# EAGLE schematic RGB_IR_J010131revC (EAGLE 7.7.0), part 2 of 2
## Sheet 4 of 4
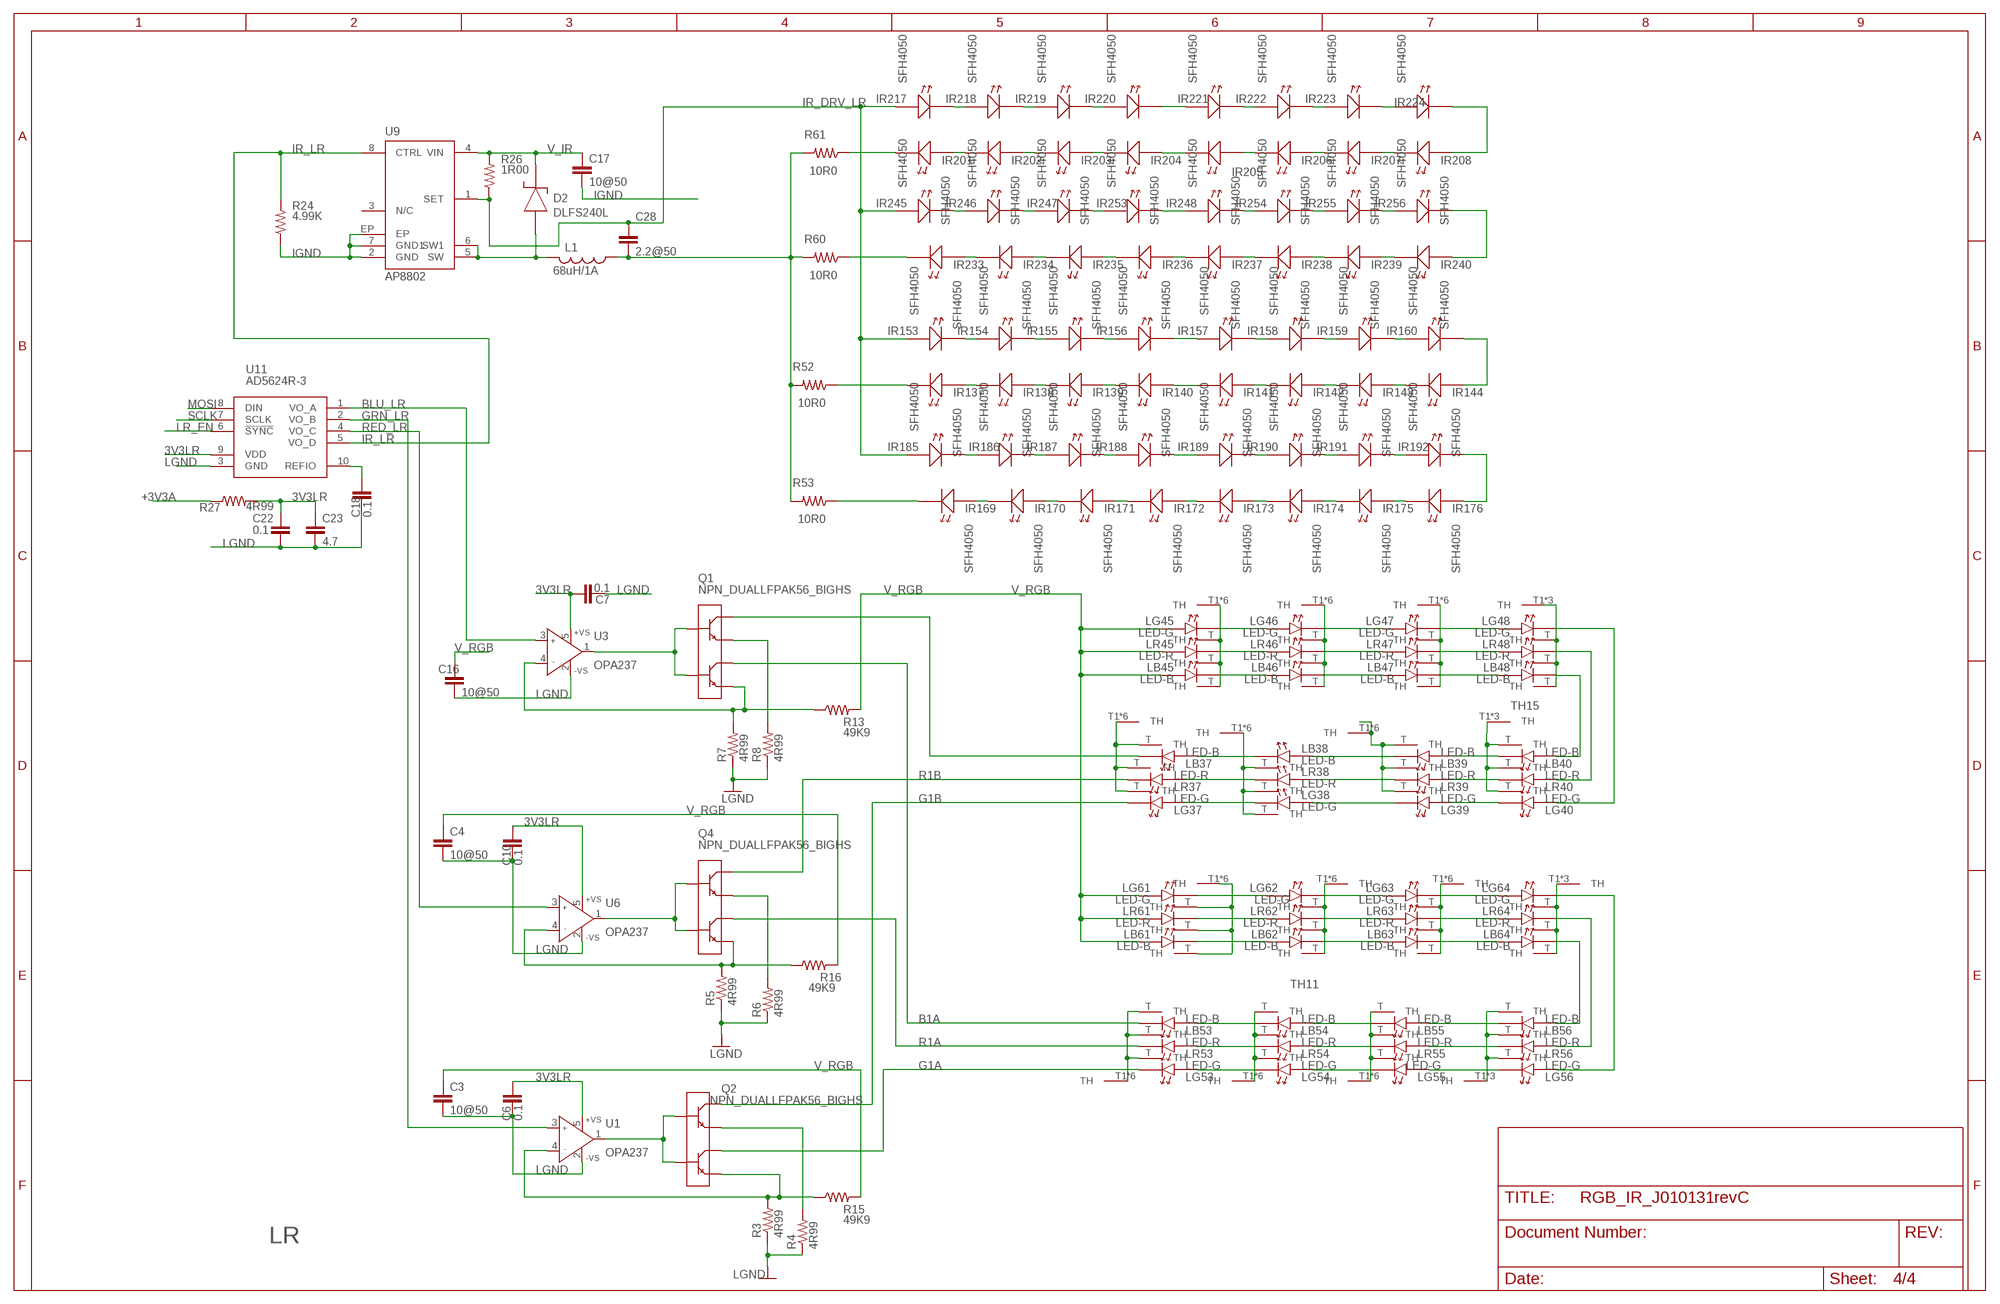
[diagram p3: schematic, sheet 4]

### Parts
C3  10@50  CAPS1210S  [1210S]
C4  10@50  CAPS1210S  [1210S]
C6  0.1  CAPS0603S  [0603S]
C7  0.1  CAPS0603S  [0603S]
C10  0.1  CAPS0603S  [0603S]
C16  10@50  CAPS1210S  [1210S]
C17  10@50  CAPS1210S  [1210S]
C18  0.1  CAPS0603S  [0603S]
C22  0.1  CAPS0603S  [0603S]
C23  4.7  CAPS0805S  [0805S]
C28  2.2@50  CAPS1206S  [1206S]
D2  DLFS240L  DIODE_SCHOTTKYPWRDI-123  [PWRDI-123]
IR137  SFH4050  LEDLED_SFH4050  [LED_SFH4050]
IR138  SFH4050  LEDLED_SFH4050_HEAT  [LED_SFH4050_HEAT]
IR139  SFH4050  LEDLED_SFH4050_HEAT  [LED_SFH4050_HEAT]
IR140  SFH4050  LEDLED_SFH4050_HEAT  [LED_SFH4050_HEAT]
IR141  SFH4050  LEDLED_SFH4050_HEAT  [LED_SFH4050_HEAT]
IR142  SFH4050  LEDLED_SFH4050_HEAT  [LED_SFH4050_HEAT]
IR143  SFH4050  LEDLED_SFH4050_HEAT  [LED_SFH4050_HEAT]
IR144  SFH4050  LEDLED_SFH4050_HEAT  [LED_SFH4050_HEAT]
IR153  SFH4050  LEDLED_SFH4050_HEAT  [LED_SFH4050_HEAT]
IR154  SFH4050  LEDLED_SFH4050_A  [LED_SFH4045_HEAT_A]
IR155  SFH4050  LEDLED_SFH4050_HEAT  [LED_SFH4050_HEAT]
IR156  SFH4050  LEDLED_SFH4050_HEAT  [LED_SFH4050_HEAT]
IR157  SFH4050  LEDLED_SFH4050_HEAT  [LED_SFH4050_HEAT]
IR158  SFH4050  LEDLED_SFH4050_HEAT  [LED_SFH4050_HEAT]
IR159  SFH4050  LEDLED_SFH4050_HEAT  [LED_SFH4050_HEAT]
IR160  SFH4050  LEDLED_SFH4050_HEAT  [LED_SFH4050_HEAT]
IR169  SFH4050  LEDLED_SFH4050_HEAT  [LED_SFH4050_HEAT]
IR170  SFH4050  LEDLED_SFH4050_HEAT  [LED_SFH4050_HEAT]
IR171  SFH4050  LEDLED_SFH4050_HEAT  [LED_SFH4050_HEAT]
IR172  SFH4050  LEDLED_SFH4050_HEAT  [LED_SFH4050_HEAT]
IR173  SFH4050  LEDLED_SFH4050_HEAT  [LED_SFH4050_HEAT]
IR174  SFH4050  LEDLED_SFH4050_HEAT  [LED_SFH4050_HEAT]
IR175  SFH4050  LEDLED_SFH4050_HEAT  [LED_SFH4050_HEAT]
IR176  SFH4050  LEDLED_SFH4050_HEAT  [LED_SFH4050_HEAT]
IR185  SFH4050  LEDLED_SFH4050_HEAT  [LED_SFH4050_HEAT]
IR186  SFH4050  LEDLED_SFH4050_HEAT  [LED_SFH4050_HEAT]
IR187  SFH4050  LEDLED_SFH4050_HEAT  [LED_SFH4050_HEAT]
IR188  SFH4050  LEDLED_SFH4050_HEAT  [LED_SFH4050_HEAT]
IR189  SFH4050  LEDLED_SFH4050_HEAT  [LED_SFH4050_HEAT]
IR190  SFH4050  LEDLED_SFH4050_HEAT  [LED_SFH4050_HEAT]
IR191  SFH4050  LEDLED_SFH4050_HEAT  [LED_SFH4050_HEAT]
IR192  SFH4050  LEDLED_SFH4050_HEAT  [LED_SFH4050_HEAT]
IR201  SFH4050  LEDLED_SFH4050_HEAT  [LED_SFH4050_HEAT]
IR202  SFH4050  LEDLED_SFH4050_HEAT  [LED_SFH4050_HEAT]
IR203  SFH4050  LEDLED_SFH4050_HEAT  [LED_SFH4050_HEAT]
IR204  SFH4050  LEDLED_SFH4050_HEAT  [LED_SFH4050_HEAT]
IR205  SFH4050  LEDLED_SFH4050_HEAT  [LED_SFH4050_HEAT]
IR206  SFH4050  LEDLED_SFH4050_HEAT  [LED_SFH4050_HEAT]
IR207  SFH4050  LEDLED_SFH4050_HEAT  [LED_SFH4050_HEAT]
IR208  SFH4050  LEDLED_SFH4050_HEAT  [LED_SFH4050_HEAT]
IR217  SFH4050  LEDLED_SFH4050_HEAT  [LED_SFH4050_HEAT]
IR218  SFH4050  LEDLED_SFH4050_HEAT  [LED_SFH4050_HEAT]
IR219  SFH4050  LEDLED_SFH4050_HEAT  [LED_SFH4050_HEAT]
IR220  SFH4050  LEDLED_SFH4050_HEAT  [LED_SFH4050_HEAT]
IR221  SFH4050  LEDLED_SFH4050_HEAT  [LED_SFH4050_HEAT]
IR222  SFH4050  LEDLED_SFH4050_HEAT  [LED_SFH4050_HEAT]
IR223  SFH4050  LEDLED_SFH4050_HEAT  [LED_SFH4050_HEAT]
IR224  SFH4050  LEDLED_SFH4050_HEAT  [LED_SFH4050_HEAT]
IR233  SFH4050  LEDLED_SFH4050_HEAT  [LED_SFH4050_HEAT]
IR234  SFH4050  LEDLED_SFH4050_HEAT  [LED_SFH4050_HEAT]
IR235  SFH4050  LEDLED_SFH4050_HEAT  [LED_SFH4050_HEAT]
IR236  SFH4050  LEDLED_SFH4050_HEAT  [LED_SFH4050_HEAT]
IR237  SFH4050  LEDLED_SFH4050_HEAT  [LED_SFH4050_HEAT]
IR238  SFH4050  LEDLED_SFH4050_HEAT  [LED_SFH4050_HEAT]
IR239  SFH4050  LEDLED_SFH4050_HEAT  [LED_SFH4050_HEAT]
IR240  SFH4050  LEDLED_SFH4050_HEAT  [LED_SFH4050_HEAT]
IR245  SFH4050  LEDLED_SFH4050_HEAT  [LED_SFH4050_HEAT]
IR246  SFH4050  LEDLED_SFH4050_HEAT  [LED_SFH4050_HEAT]
IR247  SFH4050  LEDLED_SFH4050_HEAT  [LED_SFH4050_HEAT]
IR248  SFH4050  LEDLED_SFH4050_HEAT  [LED_SFH4050_HEAT]
IR253  SFH4050  LEDLED_SFH4050_HEAT  [LED_SFH4050_HEAT]
IR254  SFH4050  LEDLED_SFH4050_HEAT  [LED_SFH4050_HEAT]
IR255  SFH4050  LEDLED_SFH4050_HEAT  [LED_SFH4050_HEAT]
IR256  SFH4050  LEDLED_SFH4050  [LED_SFH4050]
L1  68uH/1A  INDUCTOR_SMSRU8043  [SRU8043]
LB37  LED-B  LED-TH  [SUNPLUS-LED]
LB38  LED-B  LED-TH  [SUNPLUS-LED]
LB39  LED-B  LED-TH  [SUNPLUS-LED]
LB40  LED-B  LED-TH  [SUNPLUS-LED]
LB45  LED-B  LED-TH  [SUNPLUS-LED]
LB46  LED-B  LED-TH  [SUNPLUS-LED]
LB47  LED-B  LED-TH  [SUNPLUS-LED]
LB48  LED-B  LED-TH  [SUNPLUS-LED]
LB53  LED-B  LED-TH  [SUNPLUS-LED]
LB54  LED-B  LED-TH  [SUNPLUS-LED]
LB55  LED-B  LED-TH  [SUNPLUS-LED]
LB56  LED-B  LED-TH  [SUNPLUS-LED]
LB61  LED-B  LED-TH  [SUNPLUS-LED]
LB62  LED-B  LED-TH  [SUNPLUS-LED]
LB63  LED-B  LED-TH  [SUNPLUS-LED]
LB64  LED-B  LED-TH  [SUNPLUS-LED]
LG37  LED-G  LED-TH  [SUNPLUS-LED]
LG38  LED-G  LED-TH  [SUNPLUS-LED]
LG39  LED-G  LED-TH  [SUNPLUS-LED]
LG40  LED-G  LED-TH  [SUNPLUS-LED]
LG45  LED-G  LED-TH  [SUNPLUS-LED]
LG46  LED-G  LED-TH  [SUNPLUS-LED]
LG47  LED-G  LED-TH  [SUNPLUS-LED]
LG48  LED-G  LED-TH  [SUNPLUS-LED]
LG53  LED-G  LED-TH  [SUNPLUS-LED]
LG54  LED-G  LED-TH  [SUNPLUS-LED]
LG55  LED-G  LED-TH  [SUNPLUS-LED]
LG56  LED-G  LED-TH  [SUNPLUS-LED]
LG61  LED-G  LED-TH  [SUNPLUS-LED]
LG62  LED-G  LED-TH  [SUNPLUS-LED]
LG63  LED-G  LED-TH  [SUNPLUS-LED]
LG64  LED-G  LED-TH  [SUNPLUS-LED]
LR37  LED-R  LED-TH  [SUNPLUS-LED]
LR38  LED-R  LED-TH  [SUNPLUS-LED]
LR39  LED-R  LED-TH  [SUNPLUS-LED]
LR40  LED-R  LED-TH  [SUNPLUS-LED]
LR45  LED-R  LED-TH  [SUNPLUS-LED]
LR46  LED-R  LED-TH  [SUNPLUS-LED]
LR47  LED-R  LED-TH  [SUNPLUS-LED]
LR48  LED-R  LED-TH  [SUNPLUS-LED]
LR53  LED-R  LED-TH  [SUNPLUS-LED]
LR54  LED-R  LED-TH  [SUNPLUS-LED]
LR55  LED-R  LED-TH  [SUNPLUS-LED]
LR56  LED-R  LED-TH  [SUNPLUS-LED]
LR61  LED-R  LED-TH  [SUNPLUS-LED]
LR62  LED-R  LED-TH  [SUNPLUS-LED]
LR63  LED-R  LED-TH  [SUNPLUS-LED]
LR64  LED-R  LED-TH  [SUNPLUS-LED]
Q1  NPN_DUALLFPAK56_BIGHS  [LFPAK56_HS2]
Q2  NPN_DUALLFPAK56_BIGHS  [LFPAK56_HS2]
Q4  NPN_DUALLFPAK56_BIGHS  [LFPAK56_HS2]
R3  4R99  RESISTOR-POWER1812  [1812]
R4  4R99  RESISTOR-POWER1812  [1812]
R5  4R99  RESISTOR-POWER1812  [1812]
R6  4R99  RESISTOR-POWER1812  [1812]
R7  4R99  RESISTOR-POWER1812  [1812]
R8  4R99  RESISTOR-POWER1812  [1812]
R13  49K9  RESISTOR_SM1206S  [1206S]
R15  49K9  RESISTOR_SM1206S  [1206S]
R16  49K9  RESISTOR_SM1206S  [1206S]
R24  4.99K  RESISTOR_SM0805S  [0805S]
R26  1R00  RESISTOR_SM1206S  [1206S]
R27  4R99  RESISTOR_SM0805S  [0805S]
R52  10R0  RESISTOR_SM1206S  [1206S]
R53  10R0  RESISTOR_SM1206S  [1206S]
R60  10R0  RESISTOR_SM1206S  [1206S]
R61  10R0  RESISTOR_SM1206S  [1206S]
U1  OPA237  AD8065RT  [SOT23-5]
U3  OPA237  AD8065RT  [SOT23-5]
U6  OPA237  AD8065RT  [SOT23-5]
U9  AP8802  [SOIC8-EP]
U11  AD5624R-3  AD56X4R  [MSOP10]
V37  SUNPLUS-VIAS-ONLY  [SUNPLUS-VIAS-ONLY]
V38  SUNPLUS-VIAS-ONLY  [SUNPLUS-VIAS-ONLY]
V39  SUNPLUS-VIAS-ONLY  [SUNPLUS-VIAS-ONLY]
V40  SUNPLUS-VIAS-ONLYTOPVIAS  [SUNPLUS-TOP-VIAS-ONLY]
V45  SUNPLUS-VIAS-ONLY  [SUNPLUS-VIAS-ONLY]
V46  SUNPLUS-VIAS-ONLY  [SUNPLUS-VIAS-ONLY]
V47  SUNPLUS-VIAS-ONLY  [SUNPLUS-VIAS-ONLY]
V48  SUNPLUS-VIAS-ONLYTOPVIAS  [SUNPLUS-TOP-VIAS-ONLY]
V53  SUNPLUS-VIAS-ONLY  [SUNPLUS-VIAS-ONLY]
V54  SUNPLUS-VIAS-ONLY  [SUNPLUS-VIAS-ONLY]
V55  SUNPLUS-VIAS-ONLY  [SUNPLUS-VIAS-ONLY]
V56  SUNPLUS-VIAS-ONLYTOPVIAS  [SUNPLUS-TOP-VIAS-ONLY]
V61  SUNPLUS-VIAS-ONLY  [SUNPLUS-VIAS-ONLY]
V62  SUNPLUS-VIAS-ONLY  [SUNPLUS-VIAS-ONLY]
V63  SUNPLUS-VIAS-ONLY  [SUNPLUS-VIAS-ONLY]
V64  SUNPLUS-VIAS-ONLYTOPVIAS  [SUNPLUS-TOP-VIAS-ONLY]

### Nets
3V3LR: C6.1 C7.1 C10.1 C22.1 C23.1 R27.2 U1.5(+VS) U3.5(+VS) U6.5(+VS) U11.9(VDD)
+3V3A: R27.1 ; also sheet 1,2,3
B1A: LB53.GC(K) Q1.5(C2) Q1.5A1(C2) Q1.5A(C2) Q1.5B(C2) Q1.5C1(C2) Q1.5C2(C2) Q1.5C(C2) Q1.6(C2) Q1.56(C2) Q1.56A(C2) Q1.56B(C2)
B1B: LB37.GC(K) Q1.7(C1) Q1.8(C1) Q1.8A(C1) Q1.8B(C1) Q1.8C1(C1) Q1.8C2(C1) Q1.8C3(C1) Q1.8C(C1) Q1.78(C1) Q1.78A(C1) Q1.78B(C1)
BLU_LR: U3.3(IN+) U11.1(VO_A)
G1A: LG53.GC(K) Q2.5(C2) Q2.5A1(C2) Q2.5A(C2) Q2.5B(C2) Q2.5C1(C2) Q2.5C2(C2) Q2.5C(C2) Q2.6(C2) Q2.56(C2) Q2.56A(C2) Q2.56B(C2)
G1B: LG37.GC(K) Q2.7(C1) Q2.8(C1) Q2.8A(C1) Q2.8B(C1) Q2.8C1(C1) Q2.8C2(C1) Q2.8C3(C1) Q2.8C(C1) Q2.78(C1) Q2.78A(C1) Q2.78B(C1)
GRN_LR: U1.3(IN+) U11.2(VO_B)
IGND: C17.2 R24.1 U9.2(GND) U9.7(GND1) U9.EP ; also sheet 1,2,3
IR_DRV_LR: C28.1 IR153.A IR153.A1(A) IR185.A IR185.A1(A) IR217.A IR217.A1(A) IR245.A IR245.A1(A) R26.1 U9.1(SET)
IR_LR: R24.2 U9.8(CTRL) U11.5(VO_D)
IR_RET_UL3: C28.2 L1.1 R52.2 R53.2 R60.2 R61.2
LGND: C3.2 C4.2 C6.2 C7.2 C10.2 C16.2 C18.2 C22.2 C23.2 R3.1 R4.1 R5.1 R6.1 R7.1 R8.1 U1.2(-VS) U3.2(-VS) U6.2(-VS) U11.3(GND) ; also sheet 1,2,3
LR_EN: U11.6(!SYNC) ; also sheet 1
MOSI: U11.8(DIN) ; also sheet 1,2,3
N$98: C18.1 U11.10(REFIO)
N$250: LG45.GC(K) LG46.GA(A)
N$380: IR143.A IR143.A1(A) IR144.C1(K) IR144.C(K)
N$381: IR142.A IR142.A1(A) IR143.C1(K) IR143.C(K)
N$382: IR141.A IR141.A1(A) IR142.C1(K) IR142.C(K)
N$383: IR139.A IR139.A1(A) IR140.C1(K) IR140.C(K)
N$384: IR138.A IR138.A1(A) IR139.C1(K) IR139.C(K)
N$385: IR137.A IR138.C1(K) IR138.C(K)
N$386: IR153.C1(K) IR153.C(K) IR154.A IR154.A1(A)
N$387: IR154.C(K) IR155.A IR155.A1(A)
N$388: IR155.C1(K) IR155.C(K) IR156.A IR156.A1(A)
N$389: IR140.A IR140.A1(A) IR141.C1(K) IR141.C(K)
N$390: IR175.A IR175.A1(A) IR176.C1(K) IR176.C(K)
N$391: IR174.A IR174.A1(A) IR175.C1(K) IR175.C(K)
N$392: IR173.A IR173.A1(A) IR174.C1(K) IR174.C(K)
N$393: IR172.A IR172.A1(A) IR173.C1(K) IR173.C(K)
N$394: IR171.A IR171.A1(A) IR172.C1(K) IR172.C(K)
N$395: IR170.A IR170.A1(A) IR171.C1(K) IR171.C(K)
N$396: IR169.A IR169.A1(A) IR170.C1(K) IR170.C(K)
N$397: IR157.C1(K) IR157.C(K) IR158.A IR158.A1(A)
N$398: IR158.C1(K) IR158.C(K) IR159.A IR159.A1(A)
N$399: IR159.C1(K) IR159.C(K) IR160.A IR160.A1(A)
N$400: IR185.C1(K) IR185.C(K) IR186.A IR186.A1(A)
N$401: IR186.C1(K) IR186.C(K) IR187.A IR187.A1(A)
N$402: IR187.C1(K) IR187.C(K) IR188.A IR188.A1(A)
N$403: IR189.C1(K) IR189.C(K) IR190.A IR190.A1(A)
N$404: IR190.C1(K) IR190.C(K) IR191.A IR191.A1(A)
N$405: IR191.C1(K) IR191.C(K) IR192.A IR192.A1(A)
N$406: IR156.C1(K) IR156.C(K) IR157.A IR157.A1(A)
N$407: IR144.A IR144.A1(A) IR160.C1(K) IR160.C(K)
N$408: IR188.C1(K) IR188.C(K) IR189.A IR189.A1(A)
N$409: IR176.A IR176.A1(A) IR192.C1(K) IR192.C(K)
N$410: IR137.C(K) R52.1
N$411: IR169.C1(K) IR169.C(K) R53.1
N$412: IR207.A IR207.A1(A) IR208.C1(K) IR208.C(K)
N$413: IR206.A IR206.A1(A) IR207.C1(K) IR207.C(K)
N$414: IR205.A IR205.A1(A) IR206.C1(K) IR206.C(K)
N$415: IR203.A IR203.A1(A) IR204.C1(K) IR204.C(K)
N$416: IR202.A IR202.A1(A) IR203.C1(K) IR203.C(K)
N$417: IR201.A IR201.A1(A) IR202.C1(K) IR202.C(K)
N$418: IR217.C1(K) IR217.C(K) IR218.A IR218.A1(A)
N$419: IR218.C1(K) IR218.C(K) IR219.A IR219.A1(A)
N$420: IR219.C1(K) IR219.C(K) IR220.A IR220.A1(A)
N$421: IR204.A IR204.A1(A) IR205.C1(K) IR205.C(K)
N$422: IR239.A IR239.A1(A) IR240.C1(K) IR240.C(K)
N$423: IR238.A IR238.A1(A) IR239.C1(K) IR239.C(K)
N$424: IR237.A IR237.A1(A) IR238.C1(K) IR238.C(K)
N$425: IR236.A IR236.A1(A) IR237.C1(K) IR237.C(K)
N$426: IR235.A IR235.A1(A) IR236.C1(K) IR236.C(K)
N$427: IR234.A IR234.A1(A) IR235.C1(K) IR235.C(K)
N$428: IR233.A IR233.A1(A) IR234.C1(K) IR234.C(K)
N$429: IR221.C1(K) IR221.C(K) IR222.A IR222.A1(A)
N$430: IR222.C1(K) IR222.C(K) IR223.A IR223.A1(A)
N$431: IR223.C1(K) IR223.C(K) IR224.A IR224.A1(A)
N$432: IR245.C1(K) IR245.C(K) IR246.A IR246.A1(A)
N$433: IR246.C1(K) IR246.C(K) IR247.A IR247.A1(A)
N$434: IR247.C1(K) IR247.C(K) IR253.A IR253.A1(A)
N$435: IR248.C1(K) IR248.C(K) IR254.A IR254.A1(A)
N$436: IR254.C1(K) IR254.C(K) IR255.A IR255.A1(A)
N$437: IR255.C1(K) IR255.C(K) IR256.A
N$438: IR220.C1(K) IR220.C(K) IR221.A IR221.A1(A)
N$439: IR208.A IR208.A1(A) IR224.C1(K) IR224.C(K)
N$440: IR248.A IR248.A1(A) IR253.C1(K) IR253.C(K)
N$441: IR240.A IR240.A1(A) IR256.C(K)
N$442: IR201.C1(K) IR201.C(K) R61.1
N$443: IR233.C1(K) IR233.C(K) R60.1
N$444: Q1.3(E2) R7.2 R13.1 U3.4(IN-)
N$445: D2.A L1.2 U9.5(SW) U9.6(SW1)
N$446: Q4.3(E2) R5.2 R16.1 U6.4(IN-)
N$447: Q4.2(B1) Q4.4(B2) U6.1(OUT)
N$448: LR45.GC(K) LR46.GA(A)
N$449: LB45.GC(K) LB46.GA(A)
N$450: LG46.GC(K) LG47.GA(A)
N$451: LR46.GC(K) LR47.GA(A)
N$452: LB46.GC(K) LB47.GA(A)
N$453: LG47.GC(K) LG48.GA(A)
N$454: LR47.GC(K) LR48.GA(A)
N$455: LB47.GC(K) LB48.GA(A)
N$456: LG40.GA(A) LG48.GC(K)
N$457: LR40.GA(A) LR48.GC(K)
N$458: LG61.GC(K) LG62.GA(A)
N$460: LR61.GC(K) LR62.GA(A)
N$461: LB61.GC(K) LB62.GA(A)
N$462: LG62.GC(K) LG63.GA(A)
N$463: LR62.GC(K) LR63.GA(A)
N$464: LB62.GC(K) LB63.GA(A)
N$465: LG63.GC(K) LG64.GA(A)
N$466: LR63.GC(K) LR64.GA(A)
N$467: LB63.GC(K) LB64.GA(A)
N$468: LG56.GA(A) LG64.GC(K)
N$470: Q2.3(E2) R3.2 R15.1 U1.4(IN-)
N$471: Q2.2(B1) Q2.4(B2) U1.1(OUT)
N$473: LR56.GA(A) LR64.GC(K)
N$474: LB56.GA(A) LB64.GC(K)
N$475: LB40.GA(A) LB48.GC(K)
N$476: LB37.GA(A) LB38.GC(K)
N$477: LR37.GA(A) LR38.GC(K)
N$478: LG37.GA(A) LG38.GC(K)
N$479: LB38.GA(A) LB39.GC(K)
N$480: LR38.GA(A) LR39.GC(K)
N$481: LG38.GA(A) LG39.GC(K)
N$482: LG39.GA(A) LG40.GC(K)
N$483: LR39.GA(A) LR40.GC(K)
N$484: LB39.GA(A) LB40.GC(K)
N$485: LG55.GA(A) LG56.GC(K)
N$486: LR55.GA(A) LR56.GC(K)
N$487: LB55.GA(A) LB56.GC(K)
N$488: LG54.GA(A) LG55.GC(K)
N$489: LR54.GA(A) LR55.GC(K)
N$490: LB54.GA(A) LB55.GC(K)
N$491: LG53.GA(A) LG54.GC(K)
N$492: LR53.GA(A) LR54.GC(K)
N$493: LB53.GA(A) LB54.GC(K)
N$494: Q1.2(B1) Q1.4(B2) U3.1(OUT)
N$496: Q1.1(E1) R8.2
N$497: Q4.1(E1) R6.2
N$500: Q2.1(E1) R4.2
N$533: LB45.T(TH) LG45.T(TH) LR45.T(TH) V45.T1(TH) V45.T2(TH) V45.T3(TH) V45.T4(TH) V45.T5(TH) V45.T6(TH)
N$534: LB46.T(TH) LG46.T(TH) LR46.T(TH) V46.T1(TH) V46.T2(TH) V46.T3(TH) V46.T4(TH) V46.T5(TH) V46.T6(TH)
N$535: LB47.T(TH) LG47.T(TH) LR47.T(TH) V47.T1(TH) V47.T2(TH) V47.T3(TH) V47.T4(TH) V47.T5(TH) V47.T6(TH)
N$536: LB37.T(TH) LG37.T(TH) LR37.T(TH) V37.T1(TH) V37.T2(TH) V37.T3(TH) V37.T4(TH) V37.T5(TH) V37.T6(TH)
N$537: LB40.T(TH) LG40.T(TH) LR40.T(TH) V40.T1(TH) V40.T2(TH) V40.T3(TH)
N$538: LB61.T(TH) LG61.T(TH) LR61.T(TH) V61.T1(TH) V61.T2(TH) V61.T3(TH) V61.T4(TH) V61.T5(TH) V61.T6(TH)
N$539: LB62.T(TH) LG62.T(TH) LR62.T(TH) V62.T1(TH) V62.T2(TH) V62.T3(TH) V62.T4(TH) V62.T5(TH) V62.T6(TH)
N$540: LB63.T(TH) LG63.T(TH) LR63.T(TH) V63.T1(TH) V63.T2(TH) V63.T3(TH) V63.T4(TH) V63.T5(TH) V63.T6(TH)
N$541: LB56.T(TH) LG56.T(TH) LR56.T(TH) V56.T1(TH) V56.T2(TH) V56.T3(TH)
N$542: LB55.T(TH) LG55.T(TH) LR55.T(TH) V55.T1(TH) V55.T2(TH) V55.T3(TH) V55.T4(TH) V55.T5(TH) V55.T6(TH)
N$543: LB53.T(TH) LG53.T(TH) LR53.T(TH) V53.T1(TH) V53.T2(TH) V53.T3(TH) V53.T4(TH) V53.T5(TH) V53.T6(TH)
N$544: LB38.T(TH) LG38.T(TH) LR38.T(TH) V38.T1(TH) V38.T2(TH) V38.T3(TH) V38.T4(TH) V38.T5(TH) V38.T6(TH)
R1A: LR53.GC(K) Q4.5(C2) Q4.5A1(C2) Q4.5A(C2) Q4.5B(C2) Q4.5C1(C2) Q4.5C2(C2) Q4.5C(C2) Q4.6(C2) Q4.56(C2) Q4.56A(C2) Q4.56B(C2)
R1B: LR37.GC(K) Q4.7(C1) Q4.8(C1) Q4.8A(C1) Q4.8B(C1) Q4.8C1(C1) Q4.8C2(C1) Q4.8C3(C1) Q4.8C(C1) Q4.78(C1) Q4.78A(C1) Q4.78B(C1)
RED_LR: U6.3(IN+) U11.4(VO_C)
SCLK: U11.7(SCLK) ; also sheet 1,2,3
TH7: LB39.T(TH) LG39.T(TH) LR39.T(TH) V39.T1(TH) V39.T2(TH) V39.T3(TH) V39.T4(TH) V39.T5(TH) V39.T6(TH)
TH8: LB64.T(TH) LG64.T(TH) LR64.T(TH) V64.T1(TH) V64.T2(TH) V64.T3(TH)
TH11: LB54.T(TH) LG54.T(TH) LR54.T(TH) V54.T1(TH) V54.T2(TH) V54.T3(TH) V54.T4(TH) V54.T5(TH) V54.T6(TH)
TH15: LB48.T(TH) LG48.T(TH) LR48.T(TH) V48.T1(TH) V48.T2(TH) V48.T3(TH)
V_IR: C17.1 D2.K R26.2 U9.4(VIN) ; also sheet 1,2,3
V_RGB: C3.1 C4.1 C16.1 LB45.GA(A) LB61.GA(A) LG45.GA(A) LG61.GA(A) LR45.GA(A) LR61.GA(A) R13.2 R15.2 R16.2 ; also sheet 1,2,3
Unconnected: U9.3(N/C)

### Notes on the sheet
- LR

## Library data of the parts
C1-C19 C22-C42 C44-C55 = STEVES_BU:CAPS
C20 C21 C43 = adafruit:CPOL-US: POLARIZED CAPACITOR, American symbol
D1-D5 = STEVES_BU:DIODE_SCHOTTKY
FID1-FID4 = adafruit:FIDUCIAL: For use by pick and place machines to calibrate the vision/machine, 1mm By microbuilder.eu
IR1-IR256 = STEVES_BU:LED
J1 = STEVES_BU:POWER_JACK_SHUNT
J2 = con-coax:SMA-SMD: SMA 50 Ohm Straight Jack Receptacle - Surface Mount www.johnsoncomponents.com Source: http://catalog.digikey.com .. 142-0711-201, 205, 202, 206.pdf; OC_FARNELL: unknown; OC_NEWARK: unknown
J3 = STEVES_BU:CON4
J4-J6 = STEVES_BU:CON3
L1-L4 = STEVES_BU:INDUCTOR_SM
LB1-LB64 LG1-LG64 LR1-LR64 = STEVES_BU:LED-TH
M1A M1B = SAMTEC-FLE-Mxx-Sxx_By_element14_Batch_1:SSM-114-S-SV: .025 SOCKET STRIPS , 14POS; MPN: SSM-114-S-SV; OC_FARNELL: -; OC_NEWARK: 11P7941; PACKAGE: .025 SOCKET STRIPS , 14POS; SUPPLIER: SAMTEC
PS1 = STEVES_BU:DC-DCISL
Q1-Q12 = STEVES_BU:NPN_DUAL
R1-R12 R30 R32 R35 R36 R40 R42 R50 R51 R55 R56 R64 R65 = STEVES_BU:RESISTOR-POWER
R13-R29 R31 R33 R34 R37-R39 R41 R43-R49 R52-R54 R57-R63 R66-R69 = STEVES_BU:RESISTOR_SM
SH1 SH2 = STEVES_BU:JUMPER
U1 U3-U7 U14 U15 U17 U19 U21 U23 = analog-devices:AD8065: High Performance, 145 MHz FastFET Op Amps Source: http://www.analog.com/static/imported-files/data_sheets/AD8065_8066.pdf; MF: ALTERA CORPORATION; MPN: AD8065ARTZ-REEL7; OC_FARNELL: 1464845; OC_NEWARK: 59K6316
U2 = 74xx-little-de:74*1G17: Single Schmitt-Trigger Buffer
U8 = 74xx-little-us:74*1G3157: Single-Pole, Double-Throw Analog Switch Source: http://focus.ti.com/lit/ds/symlink/sn74lvc1g3157.pdf
U9 U12 U18 U24 = STEVES_BU:AP8802
U10 U11 U16 U20 = STEVES_BU:AD56X4R
U13 = STEVES_BU:LM26
U22 = STEVES_BU:ADUM1100
V1-V64 = STEVES_BU:SUNPLUS-VIAS-ONLY